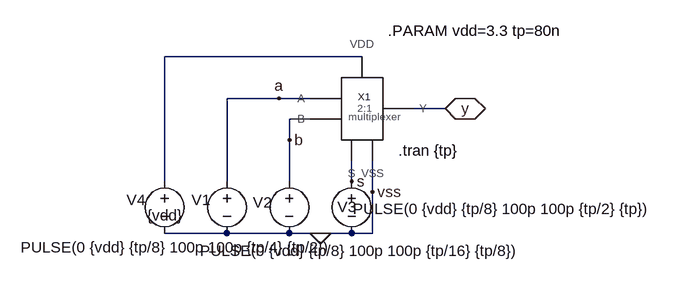
[diagram p0: schematic mux21_tb_tran.asc]
mux21_tb_tran.asc, the LTspice schematic file:
Version 4.1
SHEET 1 880 680
WIRE 224 80 -80 80
WIRE 96 144 16 144
WIRE 144 144 96 144
WIRE 352 160 304 160
WIRE 144 176 112 176
WIRE 112 208 112 176
WIRE -80 272 -80 80
WIRE 16 272 16 144
WIRE 112 272 112 208
WIRE 208 272 208 240
WIRE 240 288 240 240
WIRE 16 352 -80 352
WIRE 112 352 16 352
WIRE 160 352 112 352
WIRE 208 352 160 352
WIRE 240 352 240 288
WIRE 240 352 208 352
FLAG 96 144 a
FLAG 112 208 b
FLAG 160 352 0
FLAG 208 272 s
FLAG 240 288 vss
FLAG 352 160 y
IOPIN 352 160 BiDir
SYMBOL voltage 16 256 R0
WINDOW 0 -40 60 Bottom 2
WINDOW 3 -76 102 Top 2
WINDOW 123 0 0 Left 0
WINDOW 39 0 0 Left 0
SYMATTR InstName V1
SYMATTR Value PULSE(0 {vdd} {tp/8} 100p 100p {tp/4} {tp/2})
SYMBOL voltage 112 256 R0
WINDOW 0 -41 64 Bottom 2
WINDOW 3 111 107 Top 2
WINDOW 123 0 0 Left 0
WINDOW 39 0 0 Left 0
SYMATTR InstName V2
SYMATTR Value PULSE(0 {vdd} {tp/8} 100p 100p {tp/16} {tp/8})
SYMBOL voltage 208 256 R0
WINDOW 0 -22 55 Left 2
WINDOW 123 0 0 Left 0
WINDOW 39 0 0 Left 0
WINDOW 3 2 58 Left 2
SYMATTR InstName V3
SYMATTR Value PULSE(0 {vdd} {tp/8} 100p 100p {tp/2} {tp})
SYMBOL voltage -80 256 R0
WINDOW 0 -44 60 Bottom 2
WINDOW 3 1 53 Top 2
WINDOW 123 0 0 Left 0
WINDOW 39 0 0 Left 0
SYMATTR InstName V4
SYMATTR Value {vdd}
SYMBOL mux21 224 160 R0
WINDOW 0 -6 -19 Left 1
SYMATTR InstName X1
TEXT 280 224 Left 2 !.tran {tp}
TEXT 264 40 Left 2 !.PARAM vdd=3.3 tp=80n

The netlist it stands for:
* mux21_tb_tran.asc
V1 a 0 PULSE(0 {vdd} {tp/8} 100p 100p {tp/4} {tp/2})
V2 b 0 PULSE(0 {vdd} {tp/8} 100p 100p {tp/16} {tp/8})
V3 s 0 PULSE(0 {vdd} {tp/8} 100p 100p {tp/2} {tp})
V4 N001 0 {vdd}
X§X1 a b y s 0 N001 mux21  ; pins A B Y S VSS VDD
.tran {tp}
.PARAM vdd=3.3 tp=80n
.backanno
.end